# Altium schematic sheet 02_MCU.SchDoc
size A; SheetNumber: 2; SheetTotal: 4
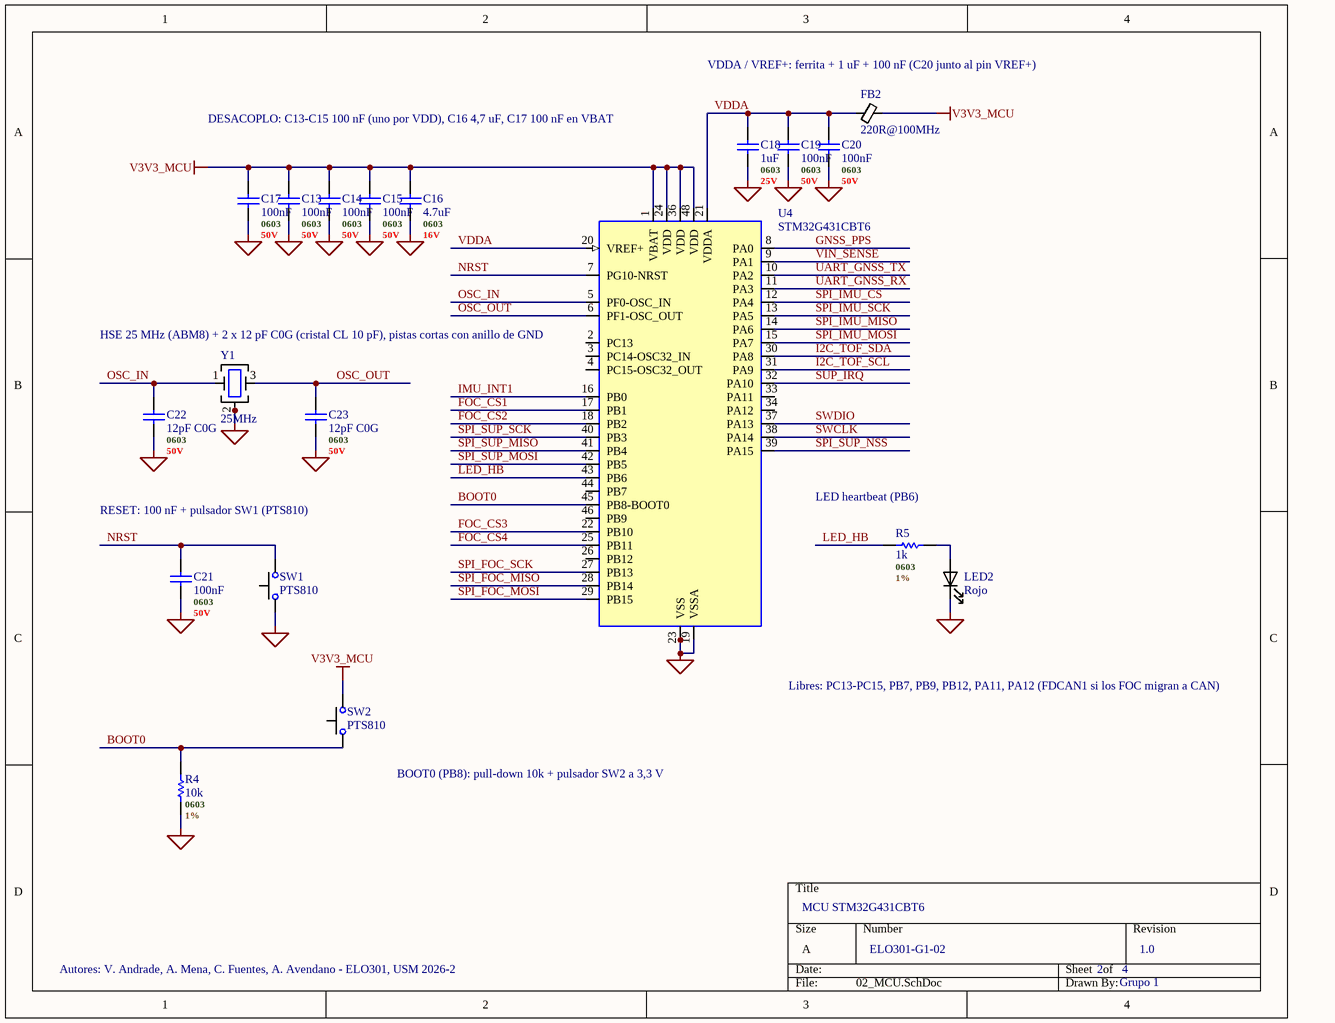
[diagram p0: 02_MCU.SchDoc]

## Parts
C13  100nF  .Case/Package: 0603  .Voltage Rating (DC): 50V  [C0603 - MURATA]
C14  100nF  .Case/Package: 0603  .Voltage Rating (DC): 50V  [C0603 - MURATA]
C15  100nF  .Case/Package: 0603  .Voltage Rating (DC): 50V  [C0603 - MURATA]
C16  4.7uF  .Case/Package: 0603  .Voltage Rating (DC): 16V  [C0603 - MURATA]
C17  100nF  .Case/Package: 0603  .Voltage Rating (DC): 50V  [C0603 - MURATA]
C18  1uF  .Case/Package: 0603  .Voltage Rating (DC): 25V  [C0603 - MURATA]
C19  100nF  .Case/Package: 0603  .Voltage Rating (DC): 50V  [C0603 - MURATA]
C20  100nF  .Case/Package: 0603  .Voltage Rating (DC): 50V  [C0603 - MURATA]
C21  100nF  .Case/Package: 0603  .Voltage Rating (DC): 50V  [C0603 - MURATA]
C22  12pF C0G  .Case/Package: 0603  .Voltage Rating (DC): 50V  [C0603 - MURATA]
C23  12pF C0G  .Case/Package: 0603  .Voltage Rating (DC): 50V  [C0603 - MURATA]
FB2  220R@100MHz  [L0603 - GENERIC]
LED2  Rojo  [LED0603 - LITEON]
R4  10k  .Case/Package: 0603  .Tolerance: 1%  [R0603 - YAGEO]
R5  1k  .Case/Package: 0603  .Tolerance: 1%  [R0603 - YAGEO]
SW1  PTS810  [PTS810 - CK]
SW2  PTS810  [PTS810 - CK]
U4  STM32G431CBT6  [LQFP-48 - ST]
Y1  25MHz  [ABM8 - ABRACON]

## Nets
GND: C13.2 C14.2 C15.2 C16.2 C17.2 C18.2 C19.2 C20.2 C21.2 C22.2 C23.2 LED2.1(K) R4.1 SW1.1 U4.19(VSSA) U4.23(VSS) U4.35(VSS) U4.47(VSS) Y1.2(G) Y1.4(G)
V3V3_MCU: C13.1 C14.1 C15.1 C16.1 C17.1 FB2.2 SW2.2 U4.1(VBAT) U4.24(VDD) U4.36(VDD) U4.48(VDD)
BOOT0: R4.2 SW2.1 U4.45(PB8-BOOT0)
FOC_CS1: U4.17(PB1)
FOC_CS2: U4.18(PB2)
FOC_CS3: U4.22(PB10)
FOC_CS4: U4.25(PB11)
GNSS_PPS: U4.8(PA0)
I2C_TOF_SCL: U4.31(PA9)
I2C_TOF_SDA: U4.30(PA8)
IMU_INT1: U4.16(PB0)
LED_HB: R5.1 U4.43(PB6)
NRST: C21.1 SW1.2 U4.7(PG10-NRST)
OSC_IN: C22.1 U4.5(PF0-OSC_IN) Y1.1
OSC_OUT: C23.1 U4.6(PF1-OSC_OUT) Y1.3
SPI_FOC_MISO: U4.28(PB14)
SPI_FOC_MOSI: U4.29(PB15)
SPI_FOC_SCK: U4.27(PB13)
SPI_IMU_CS: U4.12(PA4)
SPI_IMU_MISO: U4.14(PA6)
SPI_IMU_MOSI: U4.15(PA7)
SPI_IMU_SCK: U4.13(PA5)
SPI_SUP_MISO: U4.41(PB4)
SPI_SUP_MOSI: U4.42(PB5)
SPI_SUP_NSS: U4.39(PA15)
SPI_SUP_SCK: U4.40(PB3)
SUP_IRQ: U4.32(PA10)
SWCLK: U4.38(PA14)
SWDIO: U4.37(PA13)
UART_GNSS_RX: U4.11(PA3)
UART_GNSS_TX: U4.10(PA2)
VDDA: C18.1 C19.1 C20.1 FB2.1 U4.20(VREF+) U4.21(VDDA)
VIN_SENSE: U4.9(PA1)
NetLED2_2: LED2.2(A) R5.2

Not connected (* = marked no-connect by the designer): U4 2(PC13) 3(PC14-OSC32_IN) 4(PC15-OSC32_OUT) 26(PB12) 33(PA11) 34(PA12) 44(PB7) 46(PB9)

## Notes on the sheet
- (near FB2) VDDA / VREF+: ferrita + 1 uF + 100 nF (C20 junto al pin VREF+)
- DESACOPLO: C13-C15 100 nF (uno por VDD), C16 4,7 uF, C17 100 nF en VBAT
- (near U4) HSE 25 MHz (ABM8) + 2 x 12 pF C0G (cristal CL 10 pF), pistas cortas con anillo de GND
- LED heartbeat (PB6)
- RESET: 100 nF + pulsador SW1 (PTS810)
- Libres: PC13-PC15, PB7, PB9, PB12, PA11, PA12 (FDCAN1 si los FOC migran a CAN)
- BOOT0 (PB8): pull-down 10k + pulsador SW2 a 3,3 V
- MCU STM32G431CBT6
- Autores: V. Andrade, A. Mena, C. Fuentes, A. Avendano - ELO301, USM 2026-2
- ELO301-G1-02
- 2
- 4
- 1.0
- Grupo 1

## Library data of the parts
C13-C15 C17 C19-C21 = CAP - GENERIC: 0.1 µF ±10% 50V Ceramic Capacitor X7R 0603 (1608 Metric); Manufacturer: Murata Electronics; Manufacturer Part Number: GCM188R71H104KA57D; Case/Package: 0603; Voltage Rating (DC): 50V; Supplier 1: DigiKey; Supplier Part Number 1: 490-4779-1-ND; Category: Ceramic Capacitors; Operating Temperature: -55°C ~ 125°C; Lifecycle Status: Active; ComponentLink1Description: Datasheet; ComponentLink1URL: https://pim.murata.com/asset/pim4/ceramicCapacitorSMD/GCM188R71H104KA57-01A-EN_PDF_CERAMICCAPACITORSMD; ComponentLink2Description: DigiKey; ComponentLink2URL: https://www.digikey.com/en/products/result?keywords=GCM188R71H104KA57D
C16 = CAP - GENERIC: 4.7 µF ±20% 16V Ceramic Capacitor X5R 0603 (1608 Metric); Manufacturer: Murata Electronics; Manufacturer Part Number: GRM188R61C475ME11J; Case/Package: 0603; Voltage Rating (DC): 16V; Supplier 1: DigiKey; Supplier Part Number 1: 490-GRM188R61C475ME11JCT-ND; Category: Ceramic Capacitors; Operating Temperature: -55°C ~ 85°C; Lifecycle Status: Active; ComponentLink1Description: Datasheet; ComponentLink1URL: https://pim.murata.com/asset/pim4/ceramicCapacitorSMD/GRM188R61C475ME11-01A-EN_PDF_CERAMICCAPACITORSMD; ComponentLink2Description: DigiKey; ComponentLink2URL: https://www.digikey.com/en/products/result?keywords=GRM188R61C475ME11J
C18 = CAP - GENERIC: 1 µF ±10% 25V Ceramic Capacitor X7R 0603 (1608 Metric); Manufacturer: Murata Electronics; Manufacturer Part Number: GCM188R71E105KA64D; Case/Package: 0603; Voltage Rating (DC): 25V; Supplier 1: DigiKey; Supplier Part Number 1: 490-10673-1-ND; Category: Ceramic Capacitors; Operating Temperature: -55°C ~ 125°C; Lifecycle Status: Active; ComponentLink1Description: Datasheet; ComponentLink1URL: https://pim.murata.com/asset/pim4/ceramicCapacitorSMD/GCM188R71E105KA64-04A-EN_PDF_CERAMICCAPACITORSMD; ComponentLink2Description: DigiKey; ComponentLink2URL: https://www.digikey.com/en/products/result?keywords=GCM188R71E105KA64D
C22 C23 = CAP - GENERIC: 12 pF ±5% 50V Ceramic Capacitor C0G, NP0 0603 (1608 Metric); Manufacturer: Samsung Electro-Mechanics; Manufacturer Part Number: CL10C120JB8NNNC; Case/Package: 0603; Voltage Rating (DC): 50V; Supplier 1: DigiKey; Supplier Part Number 1: 1276-1254-1-ND; Supplier 2: LCSC; Supplier Part Number 2: C38523; Category: Ceramic Capacitors; Operating Temperature: -55°C ~ 125°C; Lifecycle Status: Active; ComponentLink1Description: Datasheet; ComponentLink1URL: https://mm.digikey.com/Volume0/opasdata/d220001/medias/docus/3682/CL10C120JB8NNNC_Spec.pdf; ComponentLink2Description: DigiKey; ComponentLink2URL: https://www.digikey.com/en/products/result?keywords=CL10C120JB8NNNC
FB2 = FERRITE - GENERIC: 220 Ohms @ 100 MHz 1 Power Line Ferrite Bead 0603 (1608 Metric) 1.4A 100mOhm; Manufacturer: Murata Electronics; Manufacturer Part Number: BLM18PG221SN1D; Supplier 1: DigiKey; Supplier Part Number 1: 490-5221-1-ND; Supplier 2: LCSC; Supplier Part Number 2: C80165; Category: Ferrite Beads and Chips; Case/Package: 0603 (1608 Metric); Operating Temperature: -55°C ~ 125°C; Lifecycle Status: Active; ComponentLink1Description: Datasheet; ComponentLink1URL: https://pim.murata.com/asset/pim4/ferriteBeadInductortypefilter/ENFA0003_PDF_FERRITEBEADINDUCTORTYPEFILTER; ComponentLink2Description: DigiKey; ComponentLink2URL: https://www.digikey.com/en/products/result?keywords=BLM18PG221SN1D
LED2 = LED - GENERIC: Red 631nm LED Indication - Discrete 2V 0603 (1608 Metric); Manufacturer: Lite-On Inc.; Manufacturer Part Number: LTST-C191KRKT; Supplier 1: DigiKey; Supplier Part Number 1: 160-1447-1-ND; Supplier 2: LCSC; Supplier Part Number 2: C125099; Category: LED Indication - Discrete; Case/Package: 0603 (1608 Metric); Lifecycle Status: Active; ComponentLink1Description: Datasheet; ComponentLink1URL: https://optoelectronics.liteon.com/upload/download/DS22-2000-223/LTST-C191KRKT.PDF; ComponentLink2Description: DigiKey; ComponentLink2URL: https://www.digikey.com/en/products/result?keywords=LTST-C191KRKT
R4 = RESISTOR - GENERIC: 10 kOhms ±1% 0.1W, 1/10W Chip Resistor 0603 (1608 Metric) Moisture Resistant Thick Film; Manufacturer: YAGEO; Manufacturer Part Number: RC0603FR-0710KL; Case/Package: 0603; Tolerance: 1%; Supplier 1: DigiKey; Supplier Part Number 1: 311-10.0KHRCT-ND; Supplier 2: LCSC; Supplier Part Number 2: C98220; Category: Chip Resistor - Surface Mount; Operating Temperature: -55°C ~ 155°C; Lifecycle Status: Active; ComponentLink1Description: Datasheet; ComponentLink1URL: https://yageogroup.com/content/datasheet/asset/file/PYU-RC_GROUP_51_ROHS_L; ComponentLink2Description: DigiKey; ComponentLink2URL: https://www.digikey.com/en/products/result?keywords=RC0603FR-0710KL
R5 = RESISTOR - GENERIC: 1 kOhms ±1% 0.1W, 1/10W Chip Resistor 0603 (1608 Metric) Moisture Resistant Thick Film; Manufacturer: YAGEO; Manufacturer Part Number: RC0603FR-071KL; Case/Package: 0603; Tolerance: 1%; Supplier 1: DigiKey; Supplier Part Number 1: 311-1.00KHRCT-ND; Supplier 2: LCSC; Supplier Part Number 2: C22548; Category: Chip Resistor - Surface Mount; Operating Temperature: -55°C ~ 155°C; Lifecycle Status: Active; ComponentLink1Description: Datasheet; ComponentLink1URL: https://yageogroup.com/content/datasheet/asset/file/PYU-RC_GROUP_51_ROHS_L; ComponentLink2Description: DigiKey; ComponentLink2URL: https://www.digikey.com/en/products/result?keywords=RC0603FR-071KL
SW1 SW2 = PTS810 SJM 250 SMTR LFS: Tactile Switch SPST-NO Top Actuated Surface Mount; Manufacturer: C&K; Manufacturer Part Number: PTS810 SJM 250 SMTR LFS; Supplier 1: DigiKey; Supplier Part Number 1: CKN10502CT-ND; Supplier 2: LCSC; Supplier Part Number 2: C116501; Category: Tactile Switches; Case/Package: 4.20mm x 3.20mm; Operating Temperature: -40°C ~ 85°C; Lifecycle Status: Active; ComponentLink1Description: Datasheet; ComponentLink1URL: https://www.littelfuse.com/assetdocs/littelfuse-c-k-tactile-pts810-series-datasheet?assetguid=f1e4bc97-66e9-4beb-99c6-eaef0bd3bff4; ComponentLink2Description: DigiKey; ComponentLink2URL: https://www.digikey.com/en/products/result?keywords=PTS810%20SJM%20250%20SMTR%20LFS
U4 = STM32G431CBT6: ARM® Cortex®-M4F STM32G4 Microcontroller IC 32-Bit 170MHz 128KB (128K x 8) FLASH 48-LQFP (7x7); Manufacturer: STMicroelectronics; Manufacturer Part Number: STM32G431CBT6; Supplier 1: DigiKey; Supplier Part Number 1: 497-19473-ND; Supplier 2: LCSC; Supplier Part Number 2: C529355; Category: Microcontrollers; Case/Package: 48-LQFP; Supplier Device Package: 48-LQFP (7x7); Operating Temperature: -40°C ~ 85°C (TA); Lifecycle Status: Active; ComponentLink1Description: Datasheet; ComponentLink1URL: https://www.st.com/resource/en/datasheet/stm32g431cb.pdf; ComponentLink2Description: DigiKey; ComponentLink2URL: https://www.digikey.com/en/products/result?keywords=STM32G431CBT6
Y1 = ABM8-25.000MHZ-10-D1G-T: 25 MHz ±10ppm Crystal 10pF 50 Ohms 4-SMD, No Lead; Manufacturer: Abracon LLC; Manufacturer Part Number: ABM8-25.000MHZ-10-D1G-T; Supplier 1: DigiKey; Supplier Part Number 1: 535-13468-1-ND; Supplier 2: LCSC; Supplier Part Number 2: C5366868; Category: Crystals; Case/Package: 4-SMD, No Lead; Supplier Device Package: 4-SMD (3.2x2.5); Operating Temperature: -40°C ~ 85°C; Lifecycle Status: Active; ComponentLink1Description: Datasheet; ComponentLink1URL: https://mm.digikey.com/Volume0/opasdata/d220001/medias/docus/6536/ABM8_Datasheet.pdf; ComponentLink2Description: DigiKey; ComponentLink2URL: https://www.digikey.com/en/products/result?keywords=ABM8-25.000MHZ-10-D1G-T